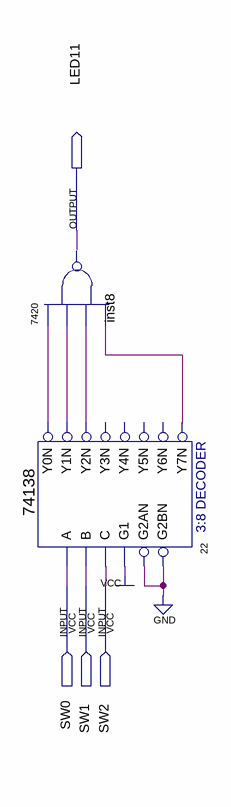
[diagram p0: schematic sheet]
// Quartus schematic CE_74138_1.bdf as structural Verilog: 2 symbols, 4 pins
module CE_74138_1 (
  input  SW0,
  input  SW1,
  input  SW2,
  output LED11
);

  wire n22_y0n, n22_y1n, n22_y2n, n22_y7n;

  \74138  u_22 (
    .A(SW0), .B(SW1), .G1(1'b1), .C(SW2), .G2AN(1'b0), .G2BN(1'b0), .Y0N(n22_y0n), .Y1N(n22_y1n),
    .Y2N(n22_y2n), .Y7N(n22_y7n));  // open: Y3N, Y4N, Y5N, Y6N
  \7420  inst8 (.\4 (n22_y2n), .\2 (n22_y0n), .\3 (n22_y1n), .\5 (n22_y7n), .\1 (LED11));
endmodule
